# Altium schematic sheet LEDS.SchDoc: ИЛ1428ТО1/1
size 410 x 297 mm; ApprovedBy: Стерхов В.Д.; CheckedBy: Стерхов В.Д.; Author: Сергеев Д.А.; CompanyName: ГК "СНАБЖЕНИЕ"; DrawnBy: Сергеев Д.А.; Engineer: Сергеев Д.А.; Organization: ГК "СНАБЖЕНИЕ"; DocumentNumber: ИЛ1428ТО1/1; Revision: 1; SheetNumber: 3; SheetTotal: 5
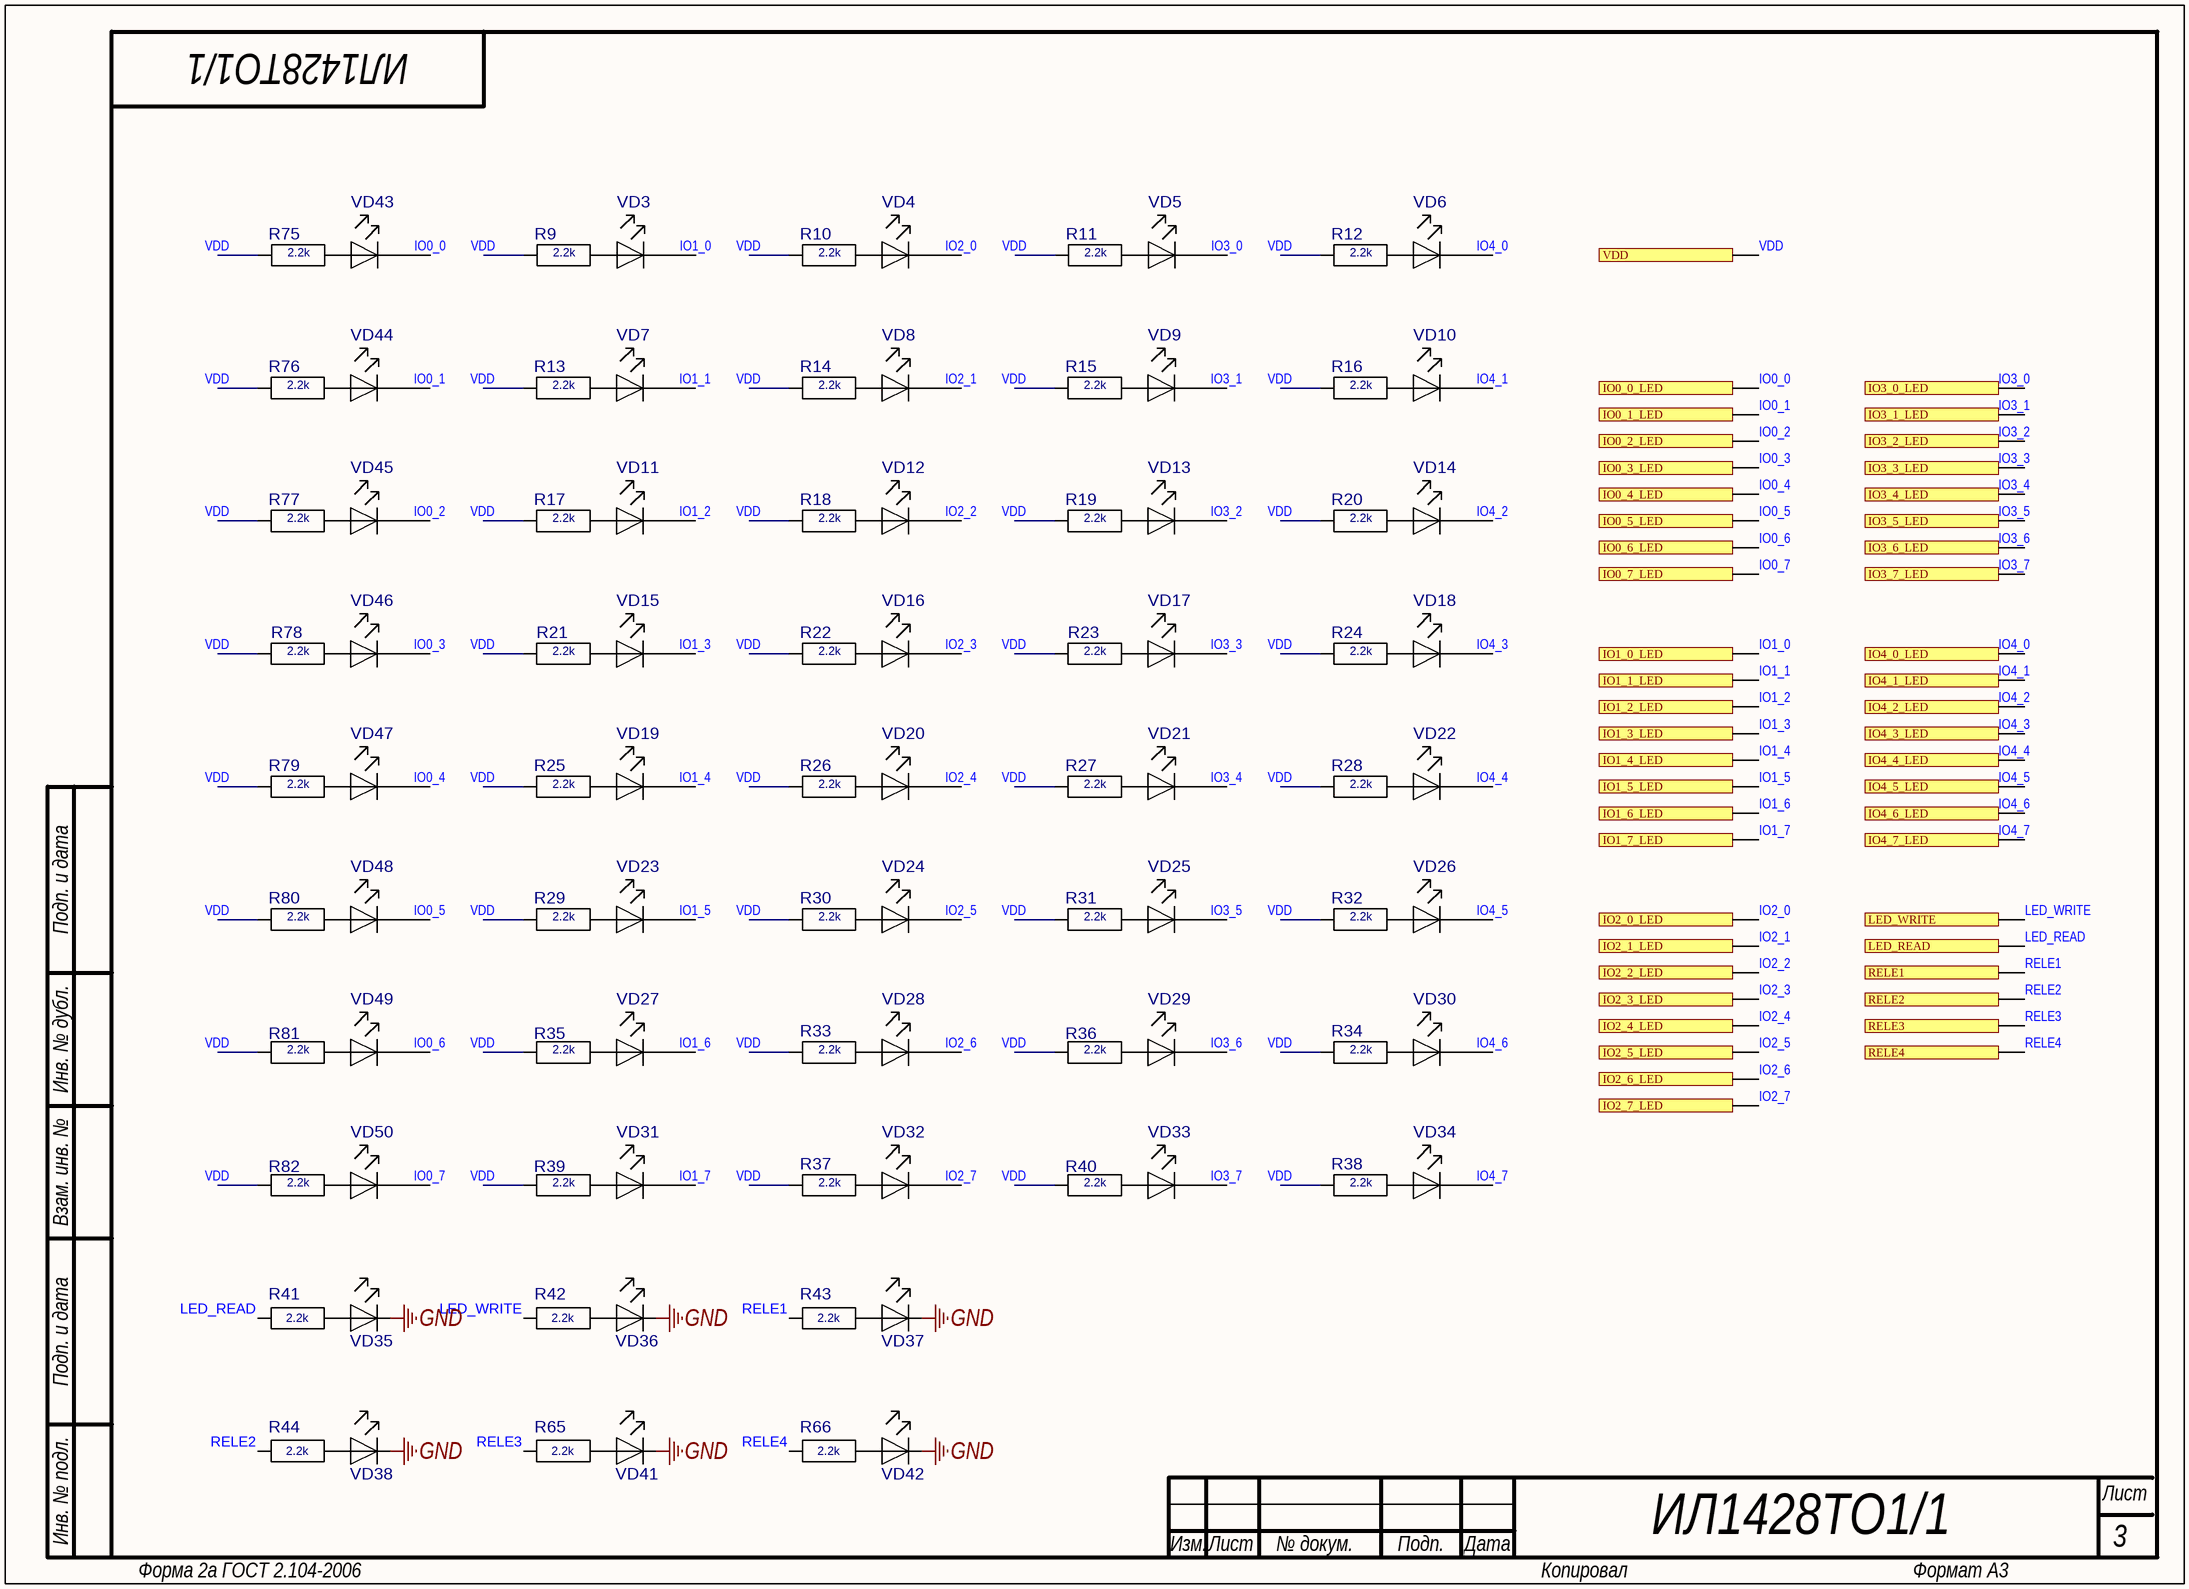
[diagram p0: LEDS.SchDoc]

## Parts
R9  2.2k  [0805]
R10  2.2k  [0805]
R11  2.2k  [0805]
R12  2.2k  [0805]
R13  2.2k  [0805]
R14  2.2k  [0805]
R15  2.2k  [0805]
R16  2.2k  [0805]
R17  2.2k  [0805]
R18  2.2k  [0805]
R19  2.2k  [0805]
R20  2.2k  [0805]
R21  2.2k  [0805]
R22  2.2k  [0805]
R23  2.2k  [0805]
R24  2.2k  [0805]
R25  2.2k  [0805]
R26  2.2k  [0805]
R27  2.2k  [0805]
R28  2.2k  [0805]
R29  2.2k  [0805]
R30  2.2k  [0805]
R31  2.2k  [0805]
R32  2.2k  [0805]
R33  2.2k  [0805]
R34  2.2k  [0805]
R35  2.2k  [0805]
R36  2.2k  [0805]
R37  2.2k  [0805]
R38  2.2k  [0805]
R39  2.2k  [0805]
R40  2.2k  [0805]
R41  2.2k  [0805]
R42  2.2k  [0805]
R43  2.2k  [0805]
R44  2.2k  [0805]
R65  2.2k  [0805]
R66  2.2k  [0805]
R75  2.2k  [0805]
R76  2.2k  [0805]
R77  2.2k  [0805]
R78  2.2k  [0805]
R79  2.2k  [0805]
R80  2.2k  [0805]
R81  2.2k  [0805]
R82  2.2k  [0805]
VD3  LED(0805)  [0805(LED)]  (value not drawn)
VD4  LED(0805)  [0805(LED)]  (value not drawn)
VD5  LED(0805)  [0805(LED)]  (value not drawn)
VD6  LED(0805)  [0805(LED)]  (value not drawn)
VD7  LED(0805)  [0805(LED)]  (value not drawn)
VD8  LED(0805)  [0805(LED)]  (value not drawn)
VD9  LED(0805)  [0805(LED)]  (value not drawn)
VD10  LED(0805)  [0805(LED)]  (value not drawn)
VD11  LED(0805)  [0805(LED)]  (value not drawn)
VD12  LED(0805)  [0805(LED)]  (value not drawn)
VD13  LED(0805)  [0805(LED)]  (value not drawn)
VD14  LED(0805)  [0805(LED)]  (value not drawn)
VD15  LED(0805)  [0805(LED)]  (value not drawn)
VD16  LED(0805)  [0805(LED)]  (value not drawn)
VD17  LED(0805)  [0805(LED)]  (value not drawn)
VD18  LED(0805)  [0805(LED)]  (value not drawn)
VD19  LED(0805)  [0805(LED)]  (value not drawn)
VD20  LED(0805)  [0805(LED)]  (value not drawn)
VD21  LED(0805)  [0805(LED)]  (value not drawn)
VD22  LED(0805)  [0805(LED)]  (value not drawn)
VD23  LED(0805)  [0805(LED)]  (value not drawn)
VD24  LED(0805)  [0805(LED)]  (value not drawn)
VD25  LED(0805)  [0805(LED)]  (value not drawn)
VD26  LED(0805)  [0805(LED)]  (value not drawn)
VD27  LED(0805)  [0805(LED)]  (value not drawn)
VD28  LED(0805)  [0805(LED)]  (value not drawn)
VD29  LED(0805)  [0805(LED)]  (value not drawn)
VD30  LED(0805)  [0805(LED)]  (value not drawn)
VD31  LED(0805)  [0805(LED)]  (value not drawn)
VD32  LED(0805)  [0805(LED)]  (value not drawn)
VD33  LED(0805)  [0805(LED)]  (value not drawn)
VD34  LED(0805)  [0805(LED)]  (value not drawn)
VD35  LED(0805)  [0805(LED)]  (value not drawn)
VD36  LED(0805)  [0805(LED)]  (value not drawn)
VD37  LED(0805)  [0805(LED)]  (value not drawn)
VD38  LED(0805)  [0805(LED)]  (value not drawn)
VD41  LED(0805)  [0805(LED)]  (value not drawn)
VD42  LED(0805)  [0805(LED)]  (value not drawn)
VD43  LED(0805)  [0805(LED)]  (value not drawn)
VD44  LED(0805)  [0805(LED)]  (value not drawn)
VD45  LED(0805)  [0805(LED)]  (value not drawn)
VD46  LED(0805)  [0805(LED)]  (value not drawn)
VD47  LED(0805)  [0805(LED)]  (value not drawn)
VD48  LED(0805)  [0805(LED)]  (value not drawn)
VD49  LED(0805)  [0805(LED)]  (value not drawn)
VD50  LED(0805)  [0805(LED)]  (value not drawn)

## Ports
IO0_0_LED, IO0_1_LED, IO0_2_LED, IO0_3_LED, IO0_4_LED, IO0_5_LED, IO0_6_LED, IO0_7_LED, IO1_0_LED, IO1_1_LED, IO1_2_LED, IO1_3_LED, IO1_4_LED, IO1_5_LED, IO1_6_LED, IO1_7_LED, IO2_0_LED, IO2_1_LED, IO2_2_LED, IO2_3_LED, IO2_4_LED, IO2_5_LED, IO2_6_LED, IO2_7_LED, IO3_0_LED, IO3_1_LED, IO3_2_LED, IO3_3_LED, IO3_4_LED, IO3_5_LED, IO3_6_LED, IO3_7_LED, IO4_0_LED, IO4_1_LED, IO4_2_LED, IO4_3_LED, IO4_4_LED, IO4_5_LED, IO4_6_LED, IO4_7_LED, LED_READ, LED_WRITE, RELE1, RELE2, RELE3, RELE4, VDD

## Nets
GND: VD35.2(K) VD36.2(K) VD37.2(K) VD38.2(K) VD41.2(K) VD42.2(K)
IO0_0: VD43.2(K) ; port IO0_0_LED
IO0_1: VD44.2(K) ; port IO0_1_LED
IO0_2: VD45.2(K) ; port IO0_2_LED
IO0_3: VD46.2(K) ; port IO0_3_LED
IO0_4: VD47.2(K) ; port IO0_4_LED
IO0_5: VD48.2(K) ; port IO0_5_LED
IO0_6: VD49.2(K) ; port IO0_6_LED
IO0_7: VD50.2(K) ; port IO0_7_LED
IO1_0: VD3.2(K) ; port IO1_0_LED
IO1_1: VD7.2(K) ; port IO1_1_LED
IO1_2: VD11.2(K) ; port IO1_2_LED
IO1_3: VD15.2(K) ; port IO1_3_LED
IO1_4: VD19.2(K) ; port IO1_4_LED
IO1_5: VD23.2(K) ; port IO1_5_LED
IO1_6: VD27.2(K) ; port IO1_6_LED
IO1_7: VD31.2(K) ; port IO1_7_LED
IO2_0: VD4.2(K) ; port IO2_0_LED
IO2_1: VD8.2(K) ; port IO2_1_LED
IO2_2: VD12.2(K) ; port IO2_2_LED
IO2_3: VD16.2(K) ; port IO2_3_LED
IO2_4: VD20.2(K) ; port IO2_4_LED
IO2_5: VD24.2(K) ; port IO2_5_LED
IO2_6: VD28.2(K) ; port IO2_6_LED
IO2_7: VD32.2(K) ; port IO2_7_LED
IO3_0: VD5.2(K) ; port IO3_0_LED
IO3_1: VD9.2(K) ; port IO3_1_LED
IO3_2: VD13.2(K) ; port IO3_2_LED
IO3_3: VD17.2(K) ; port IO3_3_LED
IO3_4: VD21.2(K) ; port IO3_4_LED
IO3_5: VD25.2(K) ; port IO3_5_LED
IO3_6: VD29.2(K) ; port IO3_6_LED
IO3_7: VD33.2(K) ; port IO3_7_LED
IO4_0: VD6.2(K) ; port IO4_0_LED
IO4_1: VD10.2(K) ; port IO4_1_LED
IO4_2: VD14.2(K) ; port IO4_2_LED
IO4_3: VD18.2(K) ; port IO4_3_LED
IO4_4: VD22.2(K) ; port IO4_4_LED
IO4_5: VD26.2(K) ; port IO4_5_LED
IO4_6: VD30.2(K) ; port IO4_6_LED
IO4_7: VD34.2(K) ; port IO4_7_LED
LED_READ: R41.1 ; port LED_READ
LED_WRITE: R42.1 ; port LED_WRITE
RELE1: R43.1 ; port RELE1
RELE2: R44.1 ; port RELE2
RELE3: R65.1 ; port RELE3
RELE4: R66.1 ; port RELE4
VDD: R9.1 R10.1 R11.1 R12.1 R13.1 R14.1 R15.1 R16.1 R17.1 R18.1 R19.1 R20.1 R21.1 R22.1 R23.1 R24.1 R25.1 R26.1 R27.1 R28.1 R29.1 R30.1 R31.1 R32.1 R33.1 R34.1 R35.1 R36.1 R37.1 R38.1 R39.1 R40.1 R75.1 R76.1 R77.1 R78.1 R79.1 R80.1 R81.1 R82.1 ; port VDD
NetR9_2: R9.2 VD3.1(A)
NetR10_2: R10.2 VD4.1(A)
NetR11_2: R11.2 VD5.1(A)
NetR12_2: R12.2 VD6.1(A)
NetR13_2: R13.2 VD7.1(A)
NetR14_2: R14.2 VD8.1(A)
NetR15_2: R15.2 VD9.1(A)
NetR16_2: R16.2 VD10.1(A)
NetR17_2: R17.2 VD11.1(A)
NetR18_2: R18.2 VD12.1(A)
NetR19_2: R19.2 VD13.1(A)
NetR20_2: R20.2 VD14.1(A)
NetR21_2: R21.2 VD15.1(A)
NetR22_2: R22.2 VD16.1(A)
NetR23_2: R23.2 VD17.1(A)
NetR24_2: R24.2 VD18.1(A)
NetR25_2: R25.2 VD19.1(A)
NetR26_2: R26.2 VD20.1(A)
NetR27_2: R27.2 VD21.1(A)
NetR28_2: R28.2 VD22.1(A)
NetR29_2: R29.2 VD23.1(A)
NetR30_2: R30.2 VD24.1(A)
NetR31_2: R31.2 VD25.1(A)
NetR32_2: R32.2 VD26.1(A)
NetR33_2: R33.2 VD28.1(A)
NetR34_2: R34.2 VD30.1(A)
NetR35_2: R35.2 VD27.1(A)
NetR36_2: R36.2 VD29.1(A)
NetR37_2: R37.2 VD32.1(A)
NetR38_2: R38.2 VD34.1(A)
NetR39_2: R39.2 VD31.1(A)
NetR40_2: R40.2 VD33.1(A)
NetR41_2: R41.2 VD35.1(A)
NetR42_2: R42.2 VD36.1(A)
NetR43_2: R43.2 VD37.1(A)
NetR44_2: R44.2 VD38.1(A)
NetR65_2: R65.2 VD41.1(A)
NetR66_2: R66.2 VD42.1(A)
NetR75_2: R75.2 VD43.1(A)
NetR76_2: R76.2 VD44.1(A)
NetR77_2: R77.2 VD45.1(A)
NetR78_2: R78.2 VD46.1(A)
NetR79_2: R79.2 VD47.1(A)
NetR80_2: R80.2 VD48.1(A)
NetR81_2: R81.2 VD49.1(A)
NetR82_2: R82.2 VD50.1(A)

## Notes on the sheet
- Подп. и дата
- Инв. № дубл.
- Взам. инв. №
- Инв. № подл.
- Изм.
- Лист
- № докум.
- Подп.
- Дата
- Форма 2а ГОСТ 2.104-2006
- Копировал
- Формат А3

## Library data of the parts
R9-R44 R65 R66 R75-R82 = R0805 Yageo: ComponentHeigt: 0.6; Firme: Yageo; Leadform: SMD; Kind: Резистор; ClassName: *; ComponentWeigt: *; Component Link: *; Packaging: 0805; NN: *; Value: *
VD3-VD38 VD41-VD50 = LED(0805): ComponentHeigt: 0.75; Leadform: в отверстия; Firme: Kingbright; NN: 24003000; KIND: Светодиод L-1154GD Kingbright; Component Link: *; ClassName: *